# Altium schematic sheet 01_ESP32_Maestro.SchDoc: 01_ESP32_Maestro.SchDoc
size Letter; Author: Miguel Donis; Organization: Altium Limited; Address1: L3, 12a Rodborough Rd; Address2: Frenchs Forest; Address3: NSW; Address4: Australia 2086; Revision: 1.0; SheetNumber: 1; SheetTotal: 5; Carnet: 22993; Curso: Digital 2; ProjectName: proyecto 3
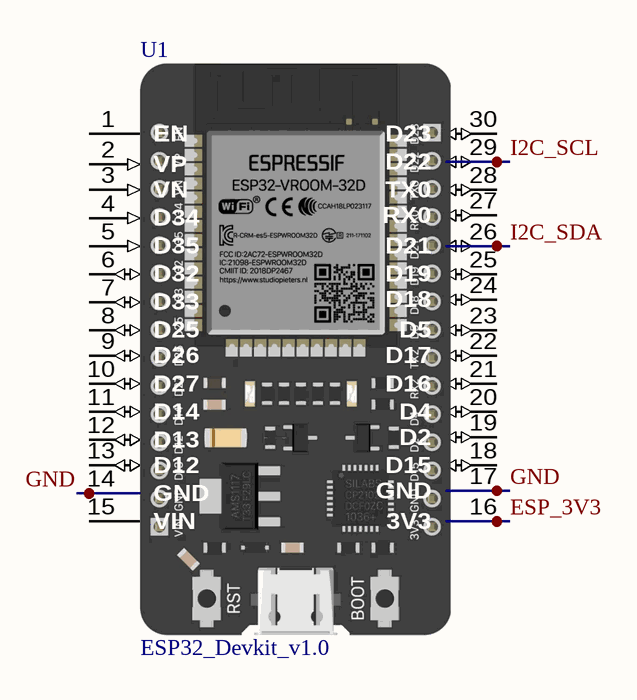
[diagram p0: 01_ESP32_Maestro.SchDoc]

## Parts
U1  ESP32_Devkit_v1.0  [ESP_32_DEKIT_V1.0]

## Nets
ESP_3V3: U1.16(3V3)
GND: U1.14(GND) U1.17(GND)
I2C_SCL: U1.29(D22)
I2C_SDA: U1.26(D21)

Not connected (* = marked no-connect by the designer): U1 1(EN) 2(VP) 3(VN) 4(D34) 5(D35) 6(D32) 7(D33) 8(D25) 9(D26) 10(D27) 11(D14) 12(D13) 13(D12) 15(VIN) 18(D15) 19(D2) 20(D4) 21(D16) 22(D17) 23(D5) 24(D18) 25(D19) 27(RX0) 28(TX0) 30(D23)

## Notes on the sheet
- Proyecto:
- Autor:
- Documento:
- Carnet:
- Curso:
- Revision:
- Fecha:
- Tamaño:
- Carta
- Hoja:
- De:

## Library data of the parts
U1 = ESP32_Devkit_v1.0: ESP32 Development kit v1.0